# Altium schematic sheet Buck-Boost_Sheet.SchDoc (part 2 of 3)
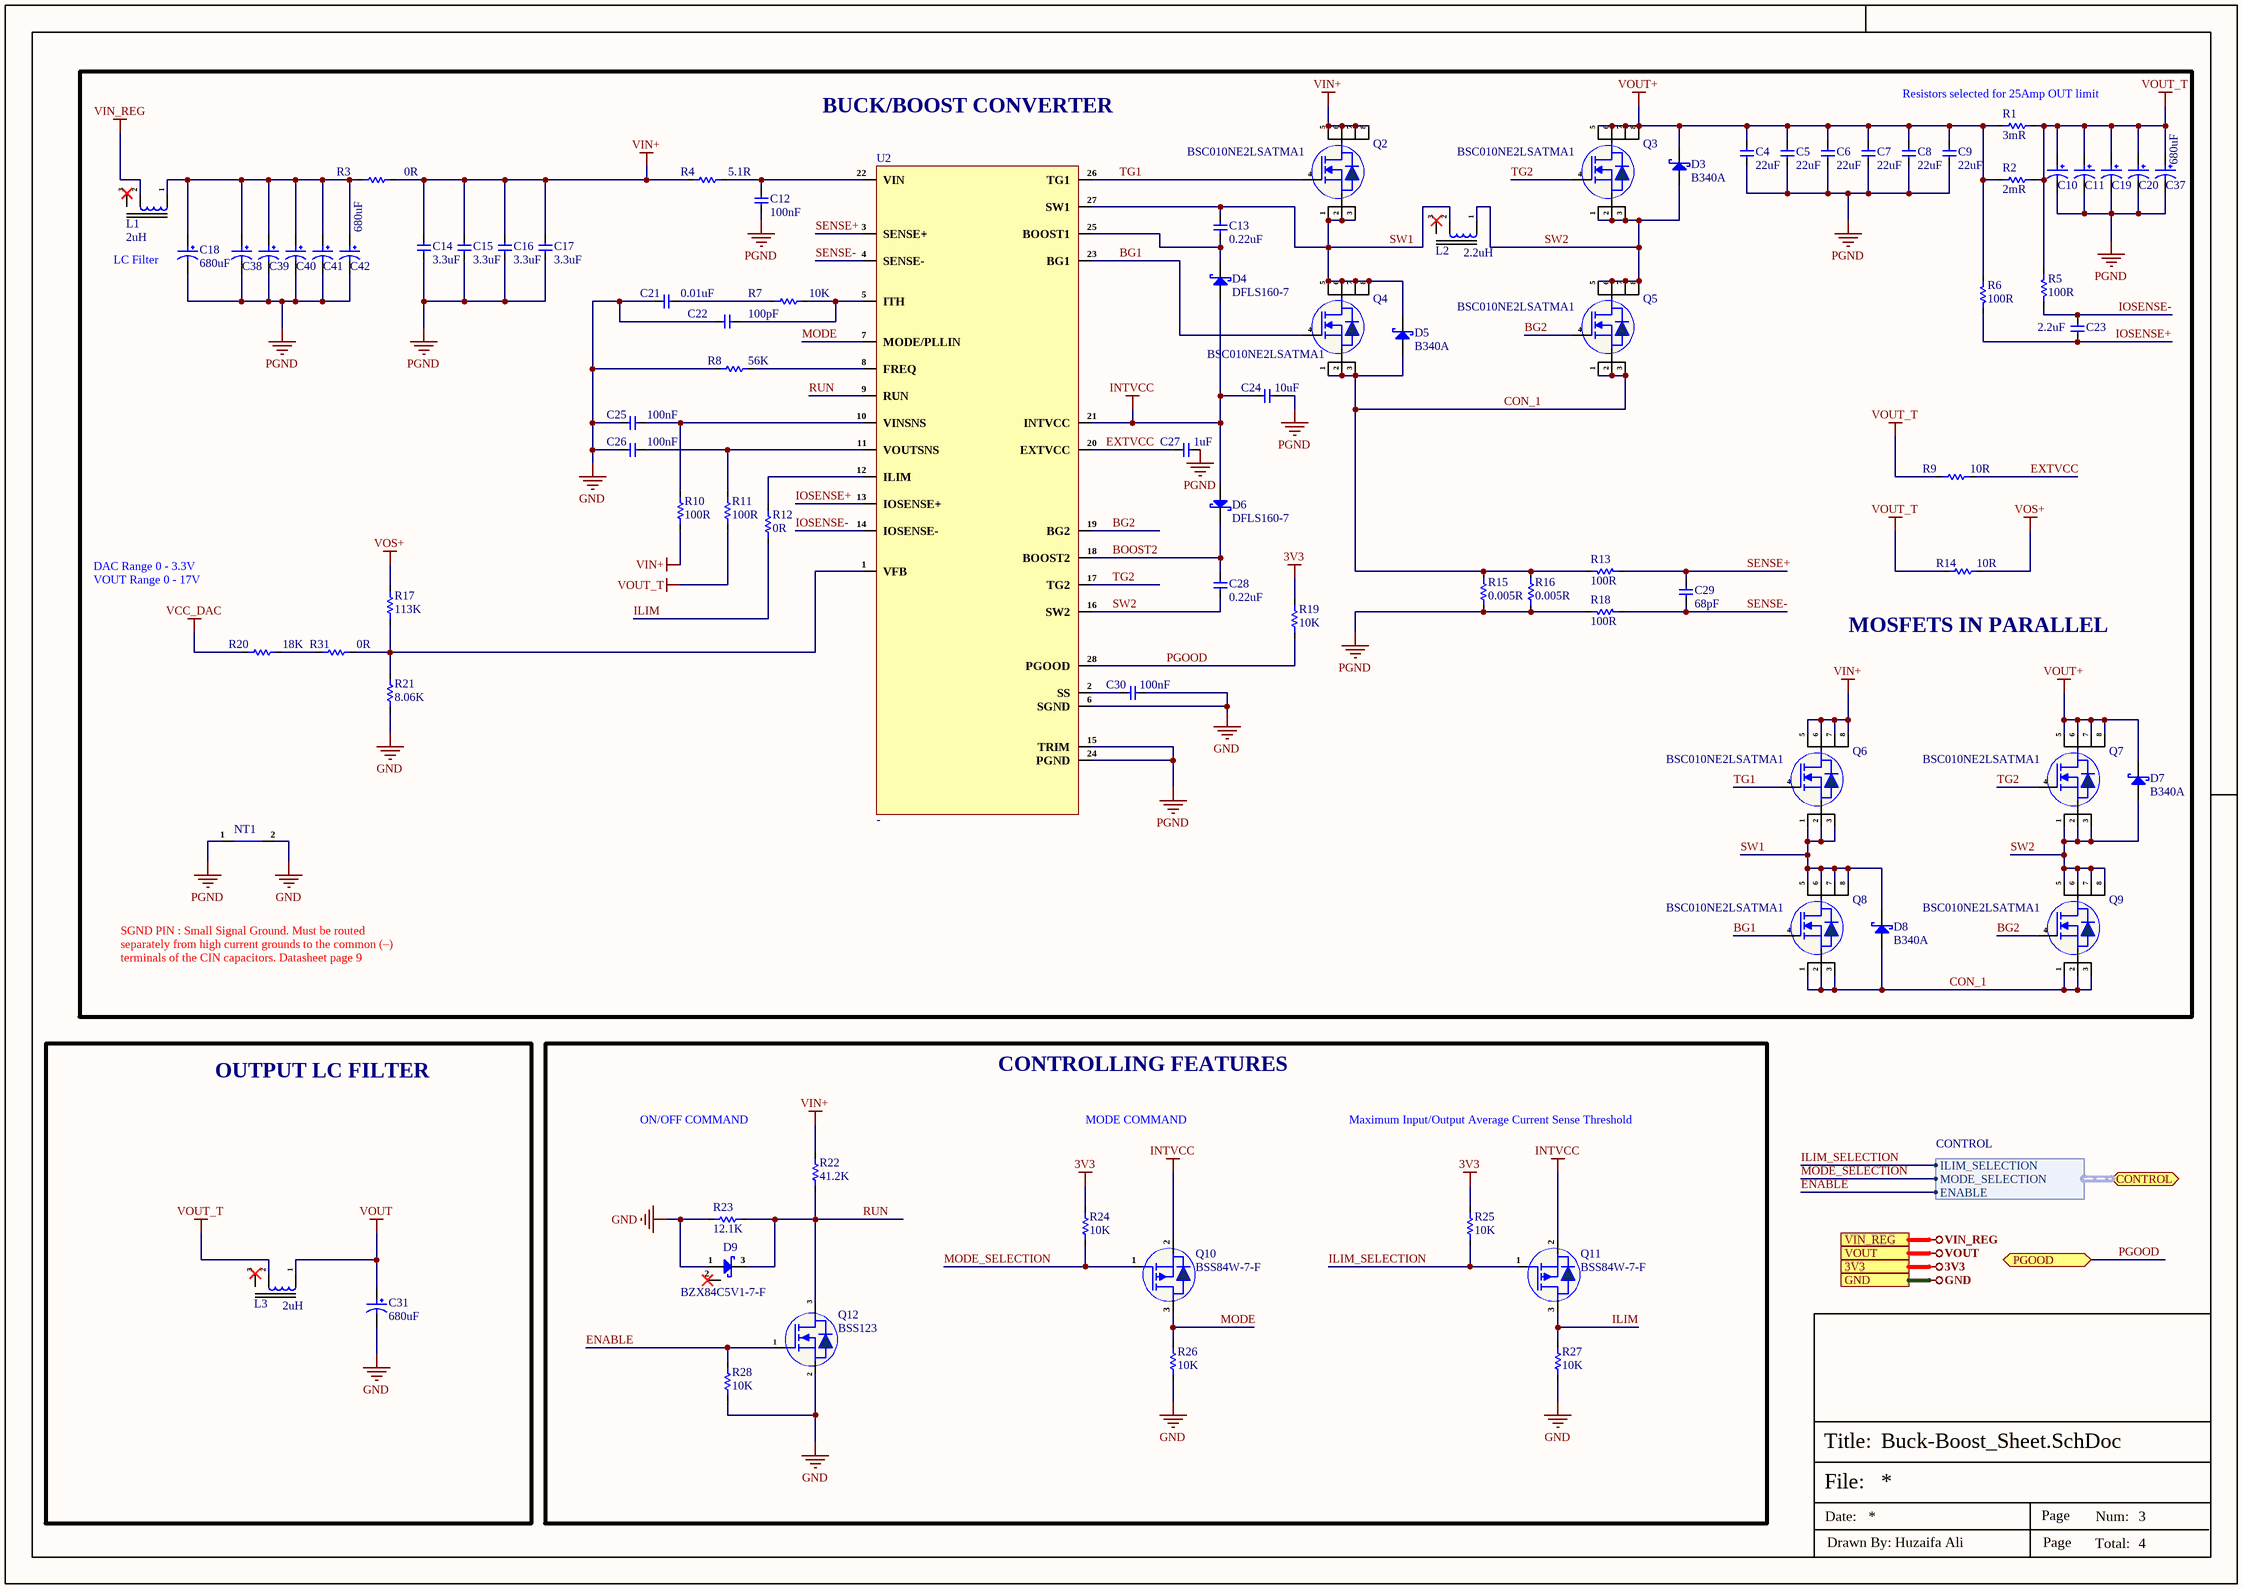
[diagram p1: Buck-Boost_Sheet.SchDoc]
## Library data of the parts
C4-C9 = C3216X5R1E226M160AB: CAP CER 22UF 25V X5R 1206; Manufacturer: TDK; Dielectric Material: Ceramic; Tolerance: 20%; Item Type: Capacitor; Supplier 1: Digi-Key; Manufacturer Part Number: C3216X5R1E226M160AB; Stock 1: 21442; Pricing 1: 1=1.08, 10=0.822, 50=0.6832, 100=0.5882, 500=0.4554, 1000=0.39215 (USD); Mount: Surface Mount; Case/Package: 1206; Case Code (Metric): 3216; Case Code (Imperial): 1206; Weight: 0.000571oz; Min Operating Temperature: -55°C; Max Operating Temperature: 85°C; Voltage Rating: 25V; Capacitance: 22uF; Packaging: Tape and Reel; Voltage Rating (DC): 25V; Dielectric: X5R; Termination: SMD/SMT; Construction: Flat; Package Quantity: 1; Resistor Type: Ceramic; Series: C; Length: 3.2mm; Width: 0.063inch; Height: 1.6mm; Depth: 1.6mm; Thickness: 0.071inch; Lead Free: Lead Free; REACH SVHC: No SVHC; RoHS Compliant: Yes; ComponentLink1URL: https://product.tdk.com/info/en/documents/chara_sheet/C3216X5R1E226M160AB.pdf?src-supplier=Digi-Key; ComponentLink1Description: https://product.tdk.com/info/en/documents/chara_sheet/C3216X5R1E226M160AB.pdf?src-supplier=Digi-Key; ComponentLink2URL: http://www.mouser.com/ds/2/400/lcc_commercial_general_en-837201.pdf?src-supplier=Mouser; ComponentLink2Description: http://www.mouser.com/ds/2/400/lcc_commercial_general_en-837201.pdf?src-supplier=Mouser; Supplier Part Number 1: 445-6000-1-ND; LCSC Part Number: C2167811
C10 C11 C18-C20 C31 C37-C42 = 50PX680MEFC12.5X20: CAP ALUM 680UF 20% 50V RADIAL; Manufacturer: Rubycon; Ripple Current (AC): 980mA; Item Type: Capacitor; Supplier: Digikey; Supplier Part Number: 1189-1409-ND; Manufacturer Part Number: 50PX680MEFC12.5X20; RoHS: Yes; Category: Aluminum Electrolytic Capacitors; Stock: 6533; Pricing: 1=0.99, 10=0.625, 50=0.4704, 100=0.422, 500=0.3404, 1000=0.31546, 3000=0.28945, 5000=0.27403 (USD); Mounting Technology: Through Hole; Case/Package: Radial; Pins: 2; Min Operating Temperature: -55°C; Max Operating Temperature: 105°C; Tolerance: 20%; Value: 680uF; Voltage Rating: 50V; Packaging: Bulk; Voltage Rating (DC): 50V; Series: PX; Diameter: 12.5mm; Height: 20mm; Lead Pitch: 5mm; Reach SVHC Compliant: No; RoHS Compliant: Yes; ComponentLink1URL: https://datasheet.ciiva.com/6327/e-px-6327166.pdf?src-supplier=Digikey; ComponentLink1Description: https://datasheet.ciiva.com/6327/e-px-6327166.pdf?src-supplier=Digikey
C12 C25 C26 C30 = CC0603KRX5R9BB104: CAP CER 0.1UF 50V X5R 0603; Manufacturer: Yageo; Tolerance: 10%; Item Type: Capacitor; Supplier 1: Digi-Key; Manufacturer Part Number: CC0603KRX5R9BB104; RoHS: Yes; Category: Ceramic Capacitors; Stock 1: 152253; Pricing 1: 1=0.10000, 10=0.05200, 50=0.02820, 100=0.02310, 500=0.01648, 1000=0.01294 (USD); Mount: Surface Mount; Case/Package: 0603; Case Code (Imperial): 0603; Case Code (Metric): 1608; Weight: 7.1E-05oz; Min Operating Temperature: -55°C; Max Operating Temperature: 85°C; Capacitance: 100nF; Packaging: Tape and Reel; Voltage Rating: 50V; Dielectric: X5R; Termination: SMD/SMT; Voltage Rating (DC): 50V; Package Quantity: 4000; Length: 0.063inch; Width: 0.031inch; Thickness: 0.035inch; Lead Free: Lead Free; Halogen Free: Halogen Free; ComponentLink1URL: http://www.mouser.com/ds/2/447/Yageo_UPY-GP_NP0_16V-to-50V_9-358835.pdf?src-supplier=Mouser; ComponentLink1Description: http://www.mouser.com/ds/2/447/Yageo_UPY-GP_NP0_16V-to-50V_9-358835.pdf?src-supplier=Mouser; ComponentLink2URL: https://www.yageo.com/upload/media/product/productsearch/datasheet/mlcc/UPY-GPHC_X5R_4V-to-50V_26.pdf?src-supplier=Digi-Key; ComponentLink2Description: https://www.yageo.com/upload/media/product/productsearch/datasheet/mlcc/UPY-GPHC_X5R_4V-to-50V_26.pdf?src-supplier=Digi-Key; ComponentLink3URL: http://www.yageo.com/exep/pages/download/literatures/ProductSelectionGuide%202014_Final_2.pdf?src-supplier=Digi-Key; ComponentLink3Description: http://www.yageo.com/exep/pages/download/literatures/ProductSelectionGuide%202014_Final_2.pdf?src-supplier=Digi-Key; Supplier Part Number 1: 311-4046-1-ND; LCSC Part Number: C110022
C13 C28 = CC0402KRX5R8BB224: CAP CER 0.22UF 25V X5R 0402; Manufacturer: Yageo; Capacitance: 220nF; Tolerance: 10%; Supplier 1: Mouser; Manufacturer Part Number: CC0402KRX5R8BB224; RoHS: Yes; Category: Ceramic Capacitors; Stock 1: 61266; Pricing 1: 1=0.10000, 10=0.03300, 50=0.03300, 100=0.02700, 1000=0.01500, 10000=0.01300 (USD); Mount: Surface Mount; Case/Package: 0402; Min Operating Temperature: -55°C; Max Operating Temperature: 85°C; Packaging: Tape and Reel; Voltage Rating: 25V; Voltage Rating (DC): 25V; Dielectric: X5R; Length: 0.039inch; Width: 0.02inch; Thickness: 0.022inch; Lead Free: Lead Free; Halogen Free: Halogen Free; RoHS Compliant: Yes; ComponentLink1URL: http://www.yageo.com/documents/recent/UPY-GPHC_X5R_4V-to-50V_25.pdf?src-supplier=Digi-Key; ComponentLink1Description: http://www.yageo.com/documents/recent/UPY-GPHC_X5R_4V-to-50V_25.pdf?src-supplier=Digi-Key; ComponentLink2URL: https://www.yageo.com/upload/media/product/productsearch/datasheet/mlcc/UPY-GPHC_X5R_4V-to-50V_26.pdf?src-supplier=Digi-Key; ComponentLink2Description: https://www.yageo.com/upload/media/product/productsearch/datasheet/mlcc/UPY-GPHC_X5R_4V-to-50V_26.pdf?src-supplier=Digi-Key; ComponentLink3URL: http://www.yageo.com/documents/recent/UPY-GPHC_X5R_4V-to-50V_23.pdf?src-supplier=Digi-Key; ComponentLink3Description: http://www.yageo.com/documents/recent/UPY-GPHC_X5R_4V-to-50V_23.pdf?src-supplier=Digi-Key; Supplier Part Number 1: 603-CC402KRX5R8BB224; LCSC Part Number: C326836
C14-C17 = C1210C335K5RAC7800: CAP CER 3.3UF 50V X7R 1210; Manufacturer: KEMET; Item Type: Capacitor; Manufacturer Part Number: C1210C335K5RAC7800; Package: 1210
C21 = GRM1885C1H103JA01D: CAP CER 10000PF 50V C0G/NP0 0603; Manufacturer: Murata; Material: Ceramic; Capacitance: 10nF; Tolerance: 5%; Dielectric: C0G; Supplier 1: RSComponents; Manufacturer Part Number: GRM1885C1H103JA01D; RoHS: Yes; Category: Ceramic Capacitors; Stock 1: 80000; Pricing 1: 4000=0.03500, 8000=0.03200 (GBP); Mount: Surface Mount; Case/Package: 0603; Case Code (Metric): 1608; Case Code (Imperial): 0603; Min Operating Temperature: -55°C; Max Operating Temperature: 125°C; Packaging: Tape and Reel; Package Quantity: 4000; Voltage Rating: 50V; Voltage Rating (DC): 50V; Termination: SMD/SMT; Voltage: 50V; Series: GRM; Length: 1.6mm; Width: 0.8mm; Height: 0.8mm; Thickness: 0.035inch; Lead Pitch: 0.5mm; Depth: 0.8mm; REACH SVHC: No SVHC; Lead Free: Lead Free; RoHS Compliant: Yes; ComponentLink1URL: https://datasheet.ciiva.com/41860/partnumbering-e-01-41860759.pdf?src-supplier=Digi-Key; ComponentLink1Description: https://datasheet.ciiva.com/41860/partnumbering-e-01-41860759.pdf?src-supplier=Digi-Key; ComponentLink2URL: https://datasheet.ciiva.com/29537/partnumbering-e-01-29537910.pdf?src-supplier=Digi-Key; ComponentLink2Description: https://datasheet.ciiva.com/29537/partnumbering-e-01-29537910.pdf?src-supplier=Digi-Key; Supplier Part Number 1: 1449032
C22 = CC0603JRNPO9BN101: CAP CER 100PF 50V C0G/NPO 0603; Manufacturer: Yageo; Tolerance: 5%; Dielectric: C0G; Temperature Coefficient: 30ppm/°C; Insulation Resistance: 100GR; Supplier 1: Arrow Electronics; Manufacturer Part Number: CC0603JRNPO9BN101; RoHS: Yes; Category: Ceramic Capacitors; Stock 1: 10744; Pricing 1: 1=0.06030, 10=0.04400, 25=0.02170, 100=0.01580, 250=0.01330, 500=0.01300, 1000=0.01150, 3000=0.01010, 6000=0.00680 (USD); Mount: Surface Mount; Case/Package: 0603; Number of Pins: 2; Case Code (Imperial): 0603; Case Code (Metric): 1608; Min Operating Temperature: -55°C; Max Operating Temperature: 125°C; Capacitance: 100pF; Voltage: 50V; Voltage Rating: 50V; Voltage Rating (DC): 50V; Packaging: Tape and Reel; Package Quantity: 1; Termination: SMD/SMT; Resistor Type: Ceramic; Series: CC; Length: 1.6mm; Width: 0.8mm; Height: 0.8mm; Thickness: 0.035inch; Depth: 0.8mm; Radiation Hardening: No; RoHS Compliant: Yes; REACH SVHC: Unknown; Lead Free: Lead Free; ComponentLink1URL: https://datasheet.ciiva.com/11786/0900766b8079c870-11786060.pdf?src-supplier=RSComponents; ComponentLink1Description: https://datasheet.ciiva.com/11786/0900766b8079c870-11786060.pdf?src-supplier=RSComponents; ComponentLink2URL: https://datasheet.ciiva.com/7978/1443161-7978127.pdf?src-supplier=Element14; ComponentLink2Description: https://datasheet.ciiva.com/7978/1443161-7978127.pdf?src-supplier=Element14; ComponentLink3URL: https://datasheet.ciiva.com/28450/1443161-28450457.pdf?src-supplier=Element14; ComponentLink3Description: https://datasheet.ciiva.com/28450/1443161-28450457.pdf?src-supplier=Element14; ComponentLink4URL: https://datasheet.ciiva.com/46430/1835847-46430151.pdf?src-supplier=Element14; ComponentLink4Description: https://datasheet.ciiva.com/46430/1835847-46430151.pdf?src-supplier=Element14; ComponentLink5URL: https://datasheet.ciiva.com/144/mlccorderingcode-144629.pdf?src-supplier=Digi-Key; ComponentLink5Description: https://datasheet.ciiva.com/144/mlccorderingcode-144629.pdf?src-supplier=Digi-Key; ComponentLink6URL: https://datasheet.ciiva.com/144/mlccorderingcode-144628.pdf?src-supplier=Digi-Key; ComponentLink6Description: https://datasheet.ciiva.com/144/mlccorderingcode-144628.pdf?src-supplier=Digi-Key; ComponentLink7URL: https://datasheet.ciiva.com/144/mlccorderingcode-144630.pdf?src-supplier=Digi-Key; ComponentLink7Description: https://datasheet.ciiva.com/144/mlccorderingcode-144630.pdf?src-supplier=Digi-Key; ComponentLink8URL: https://datasheet.ciiva.com/11464/upy-gp-np0-16v-to-50v-8-11464725.pdf?src-supplier=Avnet; ComponentLink8Description: https://datasheet.ciiva.com/11464/upy-gp-np0-16v-to-50v-8-11464725.pdf?src-supplier=Avnet; ComponentLink9URL: https://datasheet.ciiva.com/26829/getdatasheetpartid-403525-26829372.pdf?src-supplier=Verical; ComponentLink9Description: https://datasheet.ciiva.com/26829/getdatasheetpartid-403525-26829372.pdf?src-supplier=Verical; Supplier Part Number 1: CC0603JRNPO9BN101; LCSC Part Number: C14665
C23 = CC0603KRX5R8BB225: CAP CER 2.2UF 25V X5R 0603; Manufacturer: Yageo; Tolerance: 10%; Item Type: Capacitor; Supplier 1: Digi-Key; Manufacturer Part Number: CC0603KRX5R8BB225; Stock 1: 687936; Pricing 1: 1=0.4, 10=0.276, 50=0.1932, 100=0.1656, 500=0.1242, 1000=0.10488 (USD); Mount: Surface Mount; Case/Package: 0603; Case Code (Metric): 1608; Case Code (Imperial): 0603; Weight: 7.1E-05oz; Min Operating Temperature: -55°C; Max Operating Temperature: 85°C; Packaging: Tape and Reel; Capacitance: 2.2uF; Dielectric: X5R; Voltage Rating: 25V; Termination: SMD/SMT; Resistor Type: Ceramic; Voltage Rating (DC): 25V; Package Quantity: 4000; Length: 1.6mm; Width: 0.031inch; Thickness: 0.037inch; Depth: 0.8mm; Radiation Hardening: No; Lead Free: Lead Free; Halogen Free: Halogen Free; RoHS Compliant: Yes; ComponentLink1URL: https://www.verical.com/server-webapp/html/getDatasheet?partID=782757&src-supplier=Verical; ComponentLink1Description: https://www.verical.com/server-webapp/html/getDatasheet?partID=782757&src-supplier=Verical; Supplier Part Number 1: 311-1786-1-ND; LCSC Part Number: C309478
C24 = CC1206KKX5R8BB106: CAP CER 10UF 25V X5R 1206; Manufacturer: Yageo; Tolerance: 10%; Supplier 1: Digi-Key; Manufacturer Part Number: CC1206KKX5R8BB106; RoHS: Yes; Category: Ceramic Capacitors; Stock 1: 206954; Pricing 1: 1=0.56000, 10=0.39800, 50=0.30080, 100=0.26190, 500=0.19402, 1000=0.16492 (USD); Mount: Surface Mount; Case/Package: 1206; Number of Pins: 2; Case Code (Imperial): 1206; Case Code (Metric): 3216; Min Operating Temperature: -55°C; Max Operating Temperature: 85°C; Capacitance: 10uF; Dielectric: X5R; Packaging: Tape and Reel; Voltage Rating: 25V; Package Quantity: 1; Termination: SMD/SMT; Voltage Rating (DC): 25V; Series: CC; Construction: Flat; Length: 3.2mm; Width: 0.063inch; Height: 1.6mm; Thickness: 0.071inch; Depth: 1.6mm; Radiation Hardening: No; Lead Free: Lead Free; Halogen Free: Halogen Free; RoHS Compliant: Yes; ComponentLink1URL: https://datasheet.ciiva.com/184/mlccorderingcode-184043.pdf?src-supplier=Digi-Key; ComponentLink1Description: https://datasheet.ciiva.com/184/mlccorderingcode-184043.pdf?src-supplier=Digi-Key; ComponentLink2URL: https://datasheet.ciiva.com/184/mlccorderingcode-184042.pdf?src-supplier=Digi-Key; ComponentLink2Description: https://datasheet.ciiva.com/184/mlccorderingcode-184042.pdf?src-supplier=Digi-Key; ComponentLink3URL: https://datasheet.ciiva.com/184/mlccorderingcode-184044.pdf?src-supplier=Digi-Key; ComponentLink3Description: https://datasheet.ciiva.com/184/mlccorderingcode-184044.pdf?src-supplier=Digi-Key; ComponentLink4URL: https://datasheet.ciiva.com/11466/upy-gphc-x5r-4v-to-50v-12-11466558.pdf?src-supplier=Avnet; ComponentLink4Description: https://datasheet.ciiva.com/11466/upy-gphc-x5r-4v-to-50v-12-11466558.pdf?src-supplier=Avnet; ComponentLink5URL: https://datasheet.ciiva.com/15189/getdatasheetpartid-344055-15189254.pdf?src-supplier=Verical; ComponentLink5Description: https://datasheet.ciiva.com/15189/getdatasheetpartid-344055-15189254.pdf?src-supplier=Verical; Supplier Part Number 1: 311-1466-1-ND
C27 = CC0603KRX5R8BB105: CAP CER 1UF 25V X5R 0603; Manufacturer: Yageo; Tolerance: 10%; Item Type: Capacitor; Supplier 1: Digi-Key; Manufacturer Part Number: CC0603KRX5R8BB105; RoHS: Yes; Category: Ceramic Capacitors; Stock 1: 919939; Pricing 1: 1=0.12000, 10=0.08400, 50=0.04760, 100=0.03940, 500=0.02764, 1000=0.02288 (USD); Mount: Surface Mount; Case/Package: 0603; Number of Pins: 2; Case Code (Metric): 1608; Case Code (Imperial): 0603; Min Operating Temperature: -55°C; Max Operating Temperature: 85°C; Capacitance: 1uF; Dielectric: X5R; Package Quantity: 1; Voltage Rating: 25V; Packaging: Tape and Reel; Termination: SMD/SMT; Voltage Rating (DC): 25V; Series: CC; Construction: Flat; Length: 1.6mm; Width: 0.031inch; Height: 0.8mm; Thickness: 0.035inch; Depth: 0.8mm; Radiation Hardening: No; REACH SVHC: No SVHC; Lead Free: Lead Free; Halogen Free: Halogen Free; RoHS Compliant: Yes; ComponentLink1URL: https://datasheet.ciiva.com/176/mlccorderingcode-176785.pdf?src-supplier=Digi-Key; ComponentLink1Description: https://datasheet.ciiva.com/176/mlccorderingcode-176785.pdf?src-supplier=Digi-Key; ComponentLink2URL: https://datasheet.ciiva.com/176/mlccorderingcode-176786.pdf?src-supplier=Digi-Key; ComponentLink2Description: https://datasheet.ciiva.com/176/mlccorderingcode-176786.pdf?src-supplier=Digi-Key; ComponentLink3URL: https://datasheet.ciiva.com/176/mlccorderingcode-176787.pdf?src-supplier=Digi-Key; ComponentLink3Description: https://datasheet.ciiva.com/176/mlccorderingcode-176787.pdf?src-supplier=Digi-Key; ComponentLink4URL: https://datasheet.ciiva.com/17436/upy-gphc-x5r-4v-to-50v-12-17436952.pdf?src-supplier=Avnet+Europe; ComponentLink4Description: https://datasheet.ciiva.com/17436/upy-gphc-x5r-4v-to-50v-12-17436952.pdf?src-supplier=Avnet+Europe; ComponentLink5URL: https://datasheet.ciiva.com/7978/1525783-7978171.pdf?src-supplier=Element14; ComponentLink5Description: https://datasheet.ciiva.com/7978/1525783-7978171.pdf?src-supplier=Element14; ComponentLink6URL: https://datasheet.ciiva.com/11586/upy-gphc-x5r-4v-to-50v-12-11586318.pdf?src-supplier=Avnet; ComponentLink6Description: https://datasheet.ciiva.com/11586/upy-gphc-x5r-4v-to-50v-12-11586318.pdf?src-supplier=Avnet; Supplier Part Number 1: 311-1445-1-ND; LCSC Part Number: C14664
C29 = CGA3E2C0G2A680JT0Y0N: CAP CER 68PF 100V C0G 0603; Manufacturer: TDK; Item Type: Capacitor; Manufacturer Part Number: CGA3E2C0G2A680JT0Y0N; Package: 0603; LCSC Part Number: C694224
D3 D5 D7 D8 = B340A: 40V 3A 550mV@3A SMA(DO-214AC) Schottky Barrier Diodes (SBD) ROHS; Manufacturer: FUXINSEMI; Item Type: Diode; Manufacturer Part Number: B340A; Package: SMA(DO-214AC); LCSC Part Number: C3018525; ComponentLink1Description: LCSC; ComponentLink1URL: https://www.lcsc.com/product-detail/Schottky-Barrier-Diodes-SBD_FUXINSEMI-B340A_C3018525.html
D4 D6 = DFLS160-7: DIODE SCHOTTKY 60V 1A PWRDI123; Manufacturer: Diodes; Max Reverse Current: 100uA; Peak Non-Repetitive Surge Current: 50A; Forward Voltage: 500mV; Polarity: Standard; Value: 67pF; Supplier: Future Electronics; Supplier Part Number: 3129421; Manufacturer Part Number: DFLS160-7; RoHS: Yes; Category: Rectifier Diodes; Stock: 33000; Pricing: 3000=0.103, 6000=0.1, 9000=0.0986, 12000=0.0975, 15000=0.0941 (USD); Mounting Technology: Surface Mount; Pins: 2; Min Operating Temperature: -65°C; Max Operating Temperature: 150°C; Forward Current: 1A; Max Repetitive Reverse Voltage (Vrrm): 60V; Packaging: Tape and Reel; Package Quantity: 3000; Average Rectified Current: 1A; Max Forward Surge Current (Ifsm): 50A; Termination: SMD/SMT; Voltage Rating (DC): 60V; Current Rating: 1A; Output Current: 1A; Max Reverse Voltage (DC): 60V; Series: -; Length: 2.8mm; Width: 1.78mm; Height: 0.98mm; Radiation Hardening: No; Reach SVHC Compliant: No; Lead Free: Lead Free; RoHS Compliant: Yes; ComponentLink1URL: https://datasheet.ciiva.com/8301/ds30548-8301937.pdf?src-supplier=Avnet; ComponentLink1Description: https://datasheet.ciiva.com/8301/ds30548-8301937.pdf?src-supplier=Avnet; ComponentLink2URL: https://datasheet.ciiva.com/4715/ds30548-86621-4715693.pdf?src-supplier=Mouser; ComponentLink2Description: https://datasheet.ciiva.com/4715/ds30548-86621-4715693.pdf?src-supplier=Mouser; ComponentLink3URL: https://datasheet.ciiva.com/16958/0900766b80e30da9-16958716.pdf?src-supplier=Allied+Electronics; ComponentLink3Description: https://datasheet.ciiva.com/16958/0900766b80e30da9-16958716.pdf?src-supplier=Allied+Electronics; ComponentLink4URL: https://datasheet.ciiva.com/22695/ds30548-22695808.pdf?src-supplier=Element14; ComponentLink4Description: https://datasheet.ciiva.com/22695/ds30548-22695808.pdf?src-supplier=Element14; ComponentLink5URL: https://datasheet.ciiva.com/16199/ds30548-16199750.pdf?src-supplier=Future+Electronics; ComponentLink5Description: https://datasheet.ciiva.com/16199/ds30548-16199750.pdf?src-supplier=Future+Electronics; ComponentLink6URL: https://datasheet.ciiva.com/914/ds30548-914331.pdf?src-supplier=Digikey; ComponentLink6Description: https://datasheet.ciiva.com/914/ds30548-914331.pdf?src-supplier=Digikey; ComponentLink7URL: https://datasheet.ciiva.com/914/ds30548-914332.pdf?src-supplier=Digikey; ComponentLink7Description: https://datasheet.ciiva.com/914/ds30548-914332.pdf?src-supplier=Digikey; ComponentLink8URL: https://datasheet.ciiva.com/914/ds30548-914333.pdf?src-supplier=Digikey; ComponentLink8Description: https://datasheet.ciiva.com/914/ds30548-914333.pdf?src-supplier=Digikey; ComponentLink9URL: https://datasheet.ciiva.com/7964/ds30548-7964253.pdf?src-supplier=Element14; ComponentLink9Description: https://datasheet.ciiva.com/7964/ds30548-7964253.pdf?src-supplier=Element14; Item Type: Diode
D9 = BZX84C5V1-7-F: DIODE ZENER 5.1V 300MW SOT23-3; Manufacturer: Diodes; Max Power Dissipation: 350mW; Max Reverse Leakage Current: 2uA; Tolerance: 6%; Forward Voltage: 900mV; Impedance: 60R; Zener Current: 5mA; Output Current: 50mA; ESD Protection: No; Supplier: Future Electronics; Supplier Part Number: 5442215; Manufacturer Part Number: BZX84C5V1-7-F; RoHS: Yes; Category: Zener Diodes; Stock: 54000; Pricing: 3000=0.017, 12000=0.0163, 30000=0.0158, 75000=0.0153, 120000=0.0147 (USD); Mounting Technology: Surface Mount; Case/Package: SOT-23; Pins: 3; Weight: 0.000282oz; Contact Plating: Tin,Matte; Min Operating Temperature: -65°C; Max Operating Temperature: 150°C; Packaging: Tape and Reel; Zener Voltage: 5.1V; Series: -; Package Quantity: 3000; Power Dissipation: 350mW; Voltage Tolerance: 6%; Working Voltage: 5.1V; Max Reverse Current: 2uA; Test Current: 5mA; Termination: SMD/SMT; Power Rating: 350mW; Voltage Rating (DC): 5.1V; Length: 2.9mm; Width: 1.3mm; Height: 1mm; Radiation Hardening: No; RoHS Compliant: Yes; Reach SVHC Compliant: No; Lead Free: Lead Free; ComponentLink1URL: https://datasheet.ciiva.com/15141/getdatasheetpartid-28228-15141875.pdf?src-supplier=Verical; ComponentLink1Description: https://datasheet.ciiva.com/15141/getdatasheetpartid-28228-15141875.pdf?src-supplier=Verical; ComponentLink2URL: https://datasheet.ciiva.com/34303/2011627-34303826.pdf?src-supplier=Jameco; ComponentLink2Description: https://datasheet.ciiva.com/34303/2011627-34303826.pdf?src-supplier=Jameco; ComponentLink3URL: https://datasheet.ciiva.com/10643/ds18001-10643286.pdf?src-supplier=Avnet; ComponentLink3Description: https://datasheet.ciiva.com/10643/ds18001-10643286.pdf?src-supplier=Avnet; ComponentLink4URL: https://datasheet.ciiva.com/8347/ds18001-8347273.pdf?src-supplier=Avnet; ComponentLink4Description: https://datasheet.ciiva.com/8347/ds18001-8347273.pdf?src-supplier=Avnet; Item Type: Diode
L1 L3 = SER2011-202MLD: FIXED IND 2UH 40A 1.34MOHM SM; Manufacturer: Coilcraft; Core Material: Ferrite; Tolerance: 20%; Self Resonant Frequency: 56MHz; Shielding: Shielded; DC Resistance (DCR): 1.2mR; Test Frequency: 100kHz; Saturation Current: 37A; Item Type: Inductor; Supplier: Mouser; Supplier Part Number: 994-SER2011-202MLD; Manufacturer Part Number: SER2011-202MLD; RoHS: Yes; Category: Fixed Inductors; Stock: 1078; Pricing: 1=3.01, 10=3.01, 50=3.01, 100=3.01, 1000=2.19, 10000=2.19 (USD); Pins: 3; Min Operating Temperature: -40°C; Max Operating Temperature: 85°C; Packaging: Tape and Reel; Value: 2uH; Max DC Current: 40A; Termination: SMD/SMT; Series: SER2011; Inductance Tolerance: 20%; DC Current: 40A; RMS Current (Irms): 40A; Length: 19.69mm; Width: 19.55mm; Height: 10.67mm; Depth: 19.56mm; Radiation Hardening: No; Lead Free: Contains Lead; RoHS Compliant: Yes; Reach SVHC Compliant: No; Military Standard: Not; ComponentLink1URL: https://datasheet.ciiva.com/15211/getdatasheetpartid-476881-15211386.pdf?src-supplier=Verical; ComponentLink1Description: https://datasheet.ciiva.com/15211/getdatasheetpartid-476881-15211386.pdf?src-supplier=Verical; ComponentLink2URL: https://datasheet.ciiva.com/46438/1681979-46438646.pdf?src-supplier=Element14; ComponentLink2Description: https://datasheet.ciiva.com/46438/1681979-46438646.pdf?src-supplier=Element14; ComponentLink3URL: https://datasheet.ciiva.com/46438/1681979-46438647.pdf?src-supplier=Element14; ComponentLink3Description: https://datasheet.ciiva.com/46438/1681979-46438647.pdf?src-supplier=Element14; ComponentLink4URL: https://datasheet.ciiva.com/46438/1681979-46438648.pdf?src-supplier=Element14; ComponentLink4Description: https://datasheet.ciiva.com/46438/1681979-46438648.pdf?src-supplier=Element14; ComponentLink5URL: https://datasheet.ciiva.com/13142/ser2000-13142426.pdf?src-supplier=Mouser; ComponentLink5Description: https://datasheet.ciiva.com/13142/ser2000-13142426.pdf?src-supplier=Mouser
L2 = SER2915L-222KL: FIXED IND 2.2UH 30A 1.65MOHM SM; Manufacturer: Coilcraft; Core Material: Ferrite; Tolerance: 10%; Self Resonant Frequency: 50MHz; Shielding: Shielded; Max DC Current: 84.8A; Test Frequency: 100kHz; Saturation Current: 82A; Item Type: Inductor; Supplier: Mouser; Supplier Part Number: 994-SER2915L-222KL; Manufacturer Part Number: SER2915L-222KL; RoHS: Yes; Category: Fixed Inductors; Stock: 187; Pricing: 1=4.14, 10=4.14, 50=4.14, 100=4.14, 1000=3.01, 10000=3.01 (USD); Mounting Technology: Surface Mount; Case/Package: SMD/SMT; Min Operating Temperature: -40°C; Max Operating Temperature: 85°C; Packaging: Tray; Package Quantity: 25; Inductance Tolerance: 10%; Value: 2.2uH; Termination: SMD/SMT; RMS Current (Irms): 30A; Series: SER2915L; Length: 27.9mm; Width: 19.8mm; Height: 15.36mm; Reach SVHC Compliant: No; Lead Free: Contains Lead; RoHS Compliant: Yes; ComponentLink1URL: http://www.mouser.com/ds/2/597/ser2900-270685.pdf?src-supplier=Mouser; ComponentLink1Description: http://www.mouser.com/ds/2/597/ser2900-270685.pdf?src-supplier=Mouser; ComponentLink2URL: http://www.farnell.com/datasheets/1681984.pdf?src-supplier=Farnell; ComponentLink2Description: http://www.farnell.com/datasheets/1681984.pdf?src-supplier=Farnell; ComponentLink3URL: http://www.farnell.com/datasheets/1681984.pdf?src-supplier=Element14; ComponentLink3Description: http://www.farnell.com/datasheets/1681984.pdf?src-supplier=Element14
NT1 = Net Tie_SMD: Net Tie SMD; Manufacturer Part Number: Net Tie; Item Type: Net Tie Pad
Q2-Q9 = BSC010NE2LSATMA1: Mosfet N-ch 25V 39A TDSON-8 / Trans Mosfet N-ch 25V 39A Automotive 8-PIN Tdson Ep T/r; Manufacturer: Infineon; Rise Time: 6ns; Gate to Source Voltage (Vgs): 20V; Rds On Max: 1mR; Input Capacitance: 4.7nF; Max Power Dissipation: 96W; Number of Elements: 1; Item Type: MOSFET; Supplier: Mouser; Supplier Part Number: 726-BSC010NE2LS; Manufacturer Part Number: BSC010NE2LSATMA1; RoHS: Yes; Category: MOSFETs; Stock: 23008; Pricing: 1=1.65, 10=1.44, 50=1.44, 100=1.36, 1000=1.31, 10000=1.11 (USD); Mounting Technology: Surface Mount; Pins: 8; Contact Plating: Tin; Min Operating Temperature: -55°C; Max Operating Temperature: 150°C; Packaging: Tape and Reel; Continuous Drain Current (ID): 39A; Series: OptiMOS™; Power Dissipation: 96W; Max Dual Supply Voltage: 25V; Drain to Source Voltage (Vdss): 25V; Lead Free: Contains Lead; Halogen Free: Halogen Free; RoHS Compliant: Yes; ComponentLink1URL: https://datasheet.ciiva.com/11172/infineon-bsc010ne2ls-ds-v02-02-en-11172774.pdf?src-supplier=Avnet; ComponentLink1Description: https://datasheet.ciiva.com/11172/infineon-bsc010ne2ls-ds-v02-02-en-11172774.pdf?src-supplier=Avnet
Q10 Q11 = BSS84W-7-F: MOSFET P-CH 50V 130MA SOT323; Manufacturer: Diodes; Supplier: Future Electronics; Supplier Part Number: 3204492; Manufacturer Part Number: BSS84W-7-F; RoHS: Yes; Category: MOSFETs; Stock: 1359000; Pricing: 3000=0.415, 9000=0.405, 30000=0.39, 60000=0.385, 120000=0.375 (USD); ComponentLink1URL: https://datasheet.ciiva.com/17082/bss84w-7-f-17082780.pdf?src-supplier=Allied+Electronics; ComponentLink1Description: https://datasheet.ciiva.com/17082/bss84w-7-f-17082780.pdf?src-supplier=Allied+Electronics; ComponentLink2URL: https://datasheet.ciiva.com/15137/getdatasheetpartid-91759-15137729.pdf?src-supplier=Verical; ComponentLink2Description: https://datasheet.ciiva.com/15137/getdatasheetpartid-91759-15137729.pdf?src-supplier=Verical; ComponentLink3URL: https://datasheet.ciiva.com/19479/1539489-19479838.pdf?src-supplier=Jameco; ComponentLink3Description: https://datasheet.ciiva.com/19479/1539489-19479838.pdf?src-supplier=Jameco; ComponentLink4URL: https://datasheet.ciiva.com/4442/ds30205-79185-4442986.pdf?src-supplier=Mouser; ComponentLink4Description: https://datasheet.ciiva.com/4442/ds30205-79185-4442986.pdf?src-supplier=Mouser; ComponentLink5URL: https://datasheet.ciiva.com/8115/ds30205-8115434.pdf?src-supplier=Avnet; ComponentLink5Description: https://datasheet.ciiva.com/8115/ds30205-8115434.pdf?src-supplier=Avnet; ComponentLink6URL: https://datasheet.ciiva.com/934/ds30205-934605.pdf?src-supplier=Digi-Key; ComponentLink6Description: https://datasheet.ciiva.com/934/ds30205-934605.pdf?src-supplier=Digi-Key; ComponentLink7URL: https://datasheet.ciiva.com/934/ds30205-934606.pdf?src-supplier=Digi-Key; ComponentLink7Description: https://datasheet.ciiva.com/934/ds30205-934606.pdf?src-supplier=Digi-Key; ComponentLink8URL: https://datasheet.ciiva.com/934/ds30205-934607.pdf?src-supplier=Digi-Key; ComponentLink8Description: https://datasheet.ciiva.com/934/ds30205-934607.pdf?src-supplier=Digi-Key; ComponentLink9URL: https://datasheet.ciiva.com/1190/ds30205-1190308.pdf?src-supplier=Element14; ComponentLink9Description: https://datasheet.ciiva.com/1190/ds30205-1190308.pdf?src-supplier=Element14; ComponentLink10URL: https://datasheet.ciiva.com/8115/ds30205-8115325.pdf?src-supplier=Avnet; ComponentLink10Description: https://datasheet.ciiva.com/8115/ds30205-8115325.pdf?src-supplier=Avnet; LCSC Part Number: C110490; Item Type: Mosfet
Q12 = BSS123: 100V 200mA 300mW 1.06Ω@10V,200mA 3V@250uA N Channel SOT-23 MOSFETs ROHS; Manufacturer: BORN; Item Type: Mosfet; Manufacturer Part Number: BSS123; Package: SOT-23; LCSC Part Number: C431506; ComponentLink1Description: LCSC; ComponentLink1URL: https://www.lcsc.com/product-detail/MOSFETs_BORN-BSS123_C431506.html
R1 = CRE2512-FZ-R003E-3: RES 0.003 OHM 1% 3W 2512; Manufacturer: Bourns; Temperature Coefficient: 75ppm/°C; Item Type: Resistor; Supplier: Rs; Supplier Part Number: 2330765; Manufacturer Part Number: CRE2512-FZ-R003E-3; RoHS: No; Category: Chip SMD Resistors; Stock: 5080; Pricing: 10=0.364, 50=0.325, 100=0.316, 500=0.307, 1000=0.3 (GBP); Mounting Technology: Surface Mount; Case/Package: 2512; Case Code (Metric): 6432; Case Code (Imperial): 2512; Contact Plating: Tin; Min Operating Temperature: -55°C; Max Operating Temperature: 170°C; Value: 3mR; Power Rating: 3W; Tolerance: 1%; Packaging: Cut Tape; Resistor Type: Metal Alloy; Number of Terminations: 2; Termination: Solder; Max Power Dissipation: 3W; Features: Moisture Resistant,Automotive AEC-Q200; Series: CRE2512; Resistance Tolerance: 1%; Technology: METAL STRIP; Length: 0.254inch; Width: 0.132inch; Height: 0.035inch; Depth: 3.35mm; Reach SVHC Compliant: No; RoHS Compliant: No; ComponentLink1URL: https://datasheet.ciiva.com/48532/cre-48532221.pdf?src-supplier=Avnet; ComponentLink1Description: https://datasheet.ciiva.com/48532/cre-48532221.pdf?src-supplier=Avnet; ComponentLink2URL: https://datasheet.ciiva.com/46424/1838634-46424792.pdf?src-supplier=Element14; ComponentLink2Description: https://datasheet.ciiva.com/46424/1838634-46424792.pdf?src-supplier=Element14; ComponentLink3URL: https://datasheet.ciiva.com/46424/1838634-46424793.pdf?src-supplier=Element14; ComponentLink3Description: https://datasheet.ciiva.com/46424/1838634-46424793.pdf?src-supplier=Element14
R2 = CRE2512-FZ-R002E-3: RES 0.002 OHM 1% 3W 2512; Manufacturer: Bourns; Temperature Coefficient: 75ppm/°C; Item Type: Resistor; Supplier: Rs; Supplier Part Number: 2477148; Manufacturer Part Number: CRE2512-FZ-R002E-3; RoHS: No; Category: Chip SMD Resistors; Stock: 7640; Pricing: 10=0.32, 100=0.28, 500=0.23, 1000=0.217, 2000=0.212 (GBP); Mounting Technology: Surface Mount; Case/Package: 2512; Case Code (Metric): 6432; Case Code (Imperial): 2512; Contact Plating: Tin; Min Operating Temperature: -55°C; Max Operating Temperature: 170°C; Value: 2mR; Power Rating: 3W; Tolerance: 1%; Packaging: Cut Tape; Resistor Type: Metal Alloy; Number of Terminations: 2; Termination: Solder; Max Power Dissipation: 3W; Features: Moisture Resistant,Automotive AEC-Q200; Series: CRE2512; Resistance Tolerance: 1%; Technology: METAL STRIP; Length: 0.254inch; Width: 0.132inch; Height: 0.035inch; Depth: 3.35mm; Ratings: AEC-Q200; Reach SVHC Compliant: No; ComponentLink1URL: https://datasheet.ciiva.com/46424/1838634-46424789.pdf?src-supplier=Element14; ComponentLink1Description: https://datasheet.ciiva.com/46424/1838634-46424789.pdf?src-supplier=Element14
R3 = FRP2512F0000TS: 2W Thick Film Resistors ±200ppm/℃ ±1% 0Ω 2512 Chip Resistor - Surface Mount ROHS; Manufacturer: FOJAN; Manufacturer Part Number: FRP2512F0000TS; Package: 2512; LCSC Part Number: C5204052; Item Type: Resistor; ComponentLink1Description: LCSC; ComponentLink1URL: https://www.lcsc.com/product-detail/Chip-Resistor-Surface-Mount_FOJAN-FRP2512F0000TS_C5204052.html
R4 = RC0805JR-075R1L: RES 5.1 OHM 5% 1/8W 0805; Manufacturer: Yageo; Item Type: Resistor; Supplier: Future Electronics; Supplier Part Number: 9870346; Manufacturer Part Number: RC0805JR-075R1L; RoHS: Yes; Category: Chip SMD Resistors; Stock: 15000; Pricing: 5000=0.0054, 20000=0.0051, 75000=0.0048, 200000=0.0046, 500000=0.0043 (USD); ComponentLink1URL: https://datasheet.ciiva.com/2456/pyu-r-int-thick-7-2456339.pdf?src-supplier=Digikey; ComponentLink1Description: https://datasheet.ciiva.com/2456/pyu-r-int-thick-7-2456339.pdf?src-supplier=Digikey; ComponentLink2URL: https://datasheet.ciiva.com/2456/pyu-r-int-thick-7-2456340.pdf?src-supplier=Digikey; ComponentLink2Description: https://datasheet.ciiva.com/2456/pyu-r-int-thick-7-2456340.pdf?src-supplier=Digikey; ComponentLink3URL: https://datasheet.ciiva.com/2456/pyu-r-int-thick-7-2456341.pdf?src-supplier=Digikey; ComponentLink3Description: https://datasheet.ciiva.com/2456/pyu-r-int-thick-7-2456341.pdf?src-supplier=Digikey; ComponentLink4URL: https://datasheet.ciiva.com/17045/rc0805-17045032.pdf?src-supplier=Future+Electronics; ComponentLink4Description: https://datasheet.ciiva.com/17045/rc0805-17045032.pdf?src-supplier=Future+Electronics; ComponentLink5URL: https://datasheet.ciiva.com/5595/rc0805-5595916.pdf?src-supplier=Mouser; ComponentLink5Description: https://datasheet.ciiva.com/5595/rc0805-5595916.pdf?src-supplier=Mouser
R5 R6 R10 R11 R13 R18 = RC0603FR-07100RL: RES SMD 100 OHM 1% 1/10W 0603; Manufacturer: Yageo; Temperature Coefficient: 100ppm/°C; Voltage Rating (DC): 50V; Power Rating: 100mW; Item Type: Resistor; Supplier 1: Arrow Electronics; Manufacturer Part Number: RC0603FR-07100RL; RoHS: Yes; Category: Chip SMD Resistors; Stock 1: 3800000; Pricing 1: 5000=0.00300, 5000=0.00200, 5000=0.00450, 50000=0.00410, 500000=0.00230, 2500000=0.00140 (USD); Case/Package: 0603; Number of Pins: 2; Case Code (Imperial): 0603; Case Code (Metric): 1608; Size Code: 0603; Min Operating Temperature: -55°C; Max Operating Temperature: 155°C; Resistance: 100R; Tolerance: 1%; Resistor Type: Thick Film; Packaging: Tape and Reel; Voltage Rating: 50V; Termination: SMD/SMT; Features: Moisture Resistant; Series: RC; Max Power Dissipation: 100mW; Number of Terminations: 2; Construction: Rectangular; Resistance Tolerance: 1%; Technology: THICK FILM; Length: 1.6mm; Width: 0.8mm; Height: 0.45mm; Depth: 0.8mm; REACH SVHC: Unknown; Lead Free: Lead Free; RoHS Compliant: Yes; Military Standard: Not; Supplier Part Number 1: RC0603FR-07100RL; LCSC Part Number: C105588
R7 R19 R24-R28 = RC0603FR-0710KL: RES SMD 10K Ohm 1% 1/10W 0603; Manufacturer: Yageo; Resistance: 10kR; Temperature Coefficient: 100ppm/°C; Voltage Rating (DC): 50V; Power Rating: 100mW; Voltage Rating: 75V; Item Type: Resistor; Supplier 1: Digi-Key; Manufacturer Part Number: RC0603FR-0710KL; RoHS: Yes; Category: Chip SMD Resistors; Stock 1: 25249139; Pricing 1: 1=0.10000, 10=0.02400, 100=0.00970, 1000=0.00436, 2500=0.00378 (USD); Case/Package: 0603; Number of Pins: 2; Case Code (Imperial): 0603; Case Code (Metric): 1608; Weight: 7.1E-05oz; Size Code: 0603; Min Operating Temperature: -55°C; Max Operating Temperature: 155°C; Tolerance: 1%; Resistor Type: Thick Film; Packaging: Tape and Reel; Termination: SMD/SMT; Features: Moisture Resistant; Series: RC; Max Power Dissipation: 100mW; Number of Terminations: 2; Resistance Tolerance: 1%; Construction: Rectangular; Length: 1.6mm; Width: 0.8mm; Height: 0.45mm; Depth: 0.8mm; Lead Pitch: 0.3mm; REACH SVHC: Unknown; Lead Free: Lead Free; Military Standard: Not; RoHS Compliant: Yes; ComponentLink1URL: https://datasheet.ciiva.com/7660/38590-7660789.pdf?src-supplier=Element14; ComponentLink1Description: https://datasheet.ciiva.com/7660/38590-7660789.pdf?src-supplier=Element14; ComponentLink2URL: https://datasheet.ciiva.com/7983/443971-7983596.pdf?src-supplier=Element14; ComponentLink2Description: https://datasheet.ciiva.com/7983/443971-7983596.pdf?src-supplier=Element14; ComponentLink3URL: https://datasheet.ciiva.com/22747/443971-22747519.pdf?src-supplier=Element14; ComponentLink3Description: https://datasheet.ciiva.com/22747/443971-22747519.pdf?src-supplier=Element14; ComponentLink4URL: https://datasheet.ciiva.com/46440/1868787-46440891.pdf?src-supplier=Element14; ComponentLink4Description: https://datasheet.ciiva.com/46440/1868787-46440891.pdf?src-supplier=Element14; ComponentLink5URL: https://datasheet.ciiva.com/7746/1738695-7746239.pdf?src-supplier=Element14; ComponentLink5Description: https://datasheet.ciiva.com/7746/1738695-7746239.pdf?src-supplier=Element14; ComponentLink6URL: https://datasheet.ciiva.com/15189/getdatasheetpartid-409289-15189591.pdf?src-supplier=Verical; ComponentLink6Description: https://datasheet.ciiva.com/15189/getdatasheetpartid-409289-15189591.pdf?src-supplier=Verical; Supplier Part Number 1: 311-10.0KHRCT-ND; LCSC Part Number: C98220
R8 = AC0603FR-0756KL: RES SMD 56K OHM 1% 1/10W 0603; Manufacturer: Yageo; Item Type: Resistor; Supplier: Future Electronics; Supplier Part Number: 4073924; Manufacturer Part Number: AC0603FR-0756KL; RoHS: Yes; Category: Chip SMD Resistors; Stock: 100000; Pricing: 5000=0.0016, 25000=0.0015, 150000=0.0014, 500000=0.0014, 1500000=0.0013 (USD); ComponentLink1URL: http://www.mouser.com/ds/2/447/yageodocoutput-1111992.pdf?src-supplier=Mouser; ComponentLink1Description: http://www.mouser.com/ds/2/447/yageodocoutput-1111992.pdf?src-supplier=Mouser; ComponentLink2URL: http://www.yageo.com/NewPortal/yageodocoutput?fileName=/pdf/R-Chip/PYu-AC_51_RoHS_L_6.pdf&src-supplier=Digi-Key; ComponentLink2Description: http://www.yageo.com/NewPortal/yageodocoutput?fileName=/pdf/R-Chip/PYu-AC_51_RoHS_L_6.pdf&src-supplier=Digi-Key; ComponentLink3URL: https://datasheet.octopart.com/AC0603FR-0756KL-Yageo-datasheet-151884373.pdf?src-supplier=Future+Electronics; ComponentLink3Description: https://datasheet.octopart.com/AC0603FR-0756KL-Yageo-datasheet-151884373.pdf?src-supplier=Future+Electronics; LCSC Part Number: C144647
R9 R14 = RC0603FR-0710RL: RES SMD 10 OHM 1% 1/10W 0603; Manufacturer: Yageo; Temperature Coefficient: 200ppm/°C; Power Rating: 100mW; Voltage Rating: 50V; Item type: Resistor; Supplier 1: Digi-Key; Manufacturer Part Number: RC0603FR-0710RL; Stock 1: 10836596; Pricing 1: 1=0.1, 10=0.046, 100=0.0187, 1000=0.0084, 2500=0.00729 (USD); Case/Package: 0603; Number of Pins: 2; Case Code (Imperial): 0603; Case Code (Metric): 1608; Contact Plating: Tin,Matte; Min Operating Temperature: -55°C; Max Operating Temperature: 155°C; Resistance: 10R; Tolerance: 1%; Composition: Thick Film; Packaging: Tape and Reel; Voltage Rating (DC): 50V; Termination: SMD/SMT; Military Standard: Not; Length: 1.6mm; Height: 0.45mm; Width: 0.8mm; Depth: 0.8mm; Radiation Hardening: No; Lead Free: Lead Free; REACH SVHC: No SVHC; ComponentLink1URL: http://www.farnell.com/datasheets/1868787.pdf?src-supplier=Element14; ComponentLink1Description: http://www.farnell.com/datasheets/1868787.pdf?src-supplier=Element14; ComponentLink2URL: http://www.yageo.com/documents/recent/PYu-RC0603_51_RoHS_L_4.pdf?src-supplier=Avnet; ComponentLink2Description: http://www.yageo.com/documents/recent/PYu-RC0603_51_RoHS_L_4.pdf?src-supplier=Avnet; ComponentLink3URL: http://documents.rs-components.com/techlib://itc_doclist_GB.htm?stockno=5048984&src-supplier=RSComponents; ComponentLink3Description: http://documents.rs-components.com/techlib://itc_doclist_GB.htm?stockno=5048984&src-supplier=RSComponents; ComponentLink4URL: http://www.yageo.com/documents/recent/PYu-RC0603_51_RoHS_L_4.pdf?src-supplier=Avnet+Europe; ComponentLink4Description: http://www.yageo.com/documents/recent/PYu-RC0603_51_RoHS_L_4.pdf?src-supplier=Avnet+Europe; Supplier Part Number 1: 311-10.0HRDKR-ND; LCSC Part Number: C109318
R12 = RC0603FR-070RL: RES SMD 0R, 1%, 0.1W, 0603; Manufacturer: Yageo; Item Type: Resistor; Manufacturer Part Number: RC0603FR-070RL; Package: 0603; LCSC Part Number: C100044; ComponentLink9Description: LCSC; ComponentLink9URL: https://www.lcsc.com/product-detail/Chip-Resistor-Surface-Mount_YAGEO-RC0603FR-070RL_C100044.html
R15 R16 = CRE2512-FZ-R005E-3: RES 0.005 OHM 1% 3W 2512; Manufacturer: Bourns; Value: 5mR; Temperature Coefficient: 75ppm/°C; Item Type: Resistor; Supplier: Digikey; Supplier Part Number: CRE2512-FZ-R005E-3CT-ND; Manufacturer Part Number: CRE2512-FZ-R005E-3; RoHS: No; Category: Chip SMD Resistors; Stock: 75916; Pricing: 1=0.73, 10=0.509, 25=0.4356, 50=0.3788, 100=0.2967, 250=0.27144, 500=0.22094, 1000=0.17524 (USD); Mounting Technology: Surface Mount; Case/Package: 2512; Case Code (Metric): 6432; Case Code (Imperial): 2512; Contact Plating: Tin; Min Operating Temperature: -55°C; Max Operating Temperature: 170°C; Power Rating: 3W; Tolerance: 1%; Packaging: Cut Tape; Resistor Type: Metal Alloy; Number of Terminations: 2; Termination: Solder; Max Power Dissipation: 3W; Features: Moisture Resistant,Automotive AEC-Q200; Series: CRE2512; Resistance Tolerance: 1%; Technology: METAL STRIP; Length: 0.254inch; Width: 0.132inch; Height: 0.035inch; Depth: 3.35mm; Reach SVHC Compliant: No; ComponentLink1URL: https://datasheet.ciiva.com/48532/cre-48532215.pdf?src-supplier=Avnet; ComponentLink1Description: https://datasheet.ciiva.com/48532/cre-48532215.pdf?src-supplier=Avnet
R17 = RC0603FR-07113KL: RES 113K OHM 1% 1/10W 0603; Manufacturer: Yageo; Value: 113kR; Temperature Coefficient: 100ppm/°C; Power Rating: 100mW; Voltage Rating: 50V; Supplier: Digikey; Supplier Part Number: 311-113KHRCT-ND; Manufacturer Part Number: RC0603FR-07113KL; RoHS: Yes; Category: Chip SMD Resistors; Stock: 1058641; Pricing: 1=0.1, 10=0.019, 50=0.0112, 100=0.0093, 500=0.00622, 1000=0.00532 (USD); Case/Package: 0603; Contact Plating: Tin,Lead; Case Code (Imperial): 0603; Case Code (Metric): 1608; Min Operating Temperature: -55°C; Max Operating Temperature: 155°C; Tolerance: 1%; Packaging: Tape and Reel; Termination: SMD/SMT; Voltage Rating (DC): 50V; Features: Moisture Resistant; Series: RC; Max Power Dissipation: 100mW; Number of Terminations: 2; Length: 1.6mm; Width: 0.8mm; Height: 0.45mm; Lead Free: Lead Free; RoHS Compliant: Resistor; ComponentLink1URL: http://www.mouser.com/catalog/specsheets/RC0603.pdf?src-supplier=Mouser; ComponentLink1Description: http://www.mouser.com/catalog/specsheets/RC0603.pdf?src-supplier=Mouser; ComponentLink2URL: http://www.yageo.com/pdf/PYu-RC0603_51_RoHS_L_4.pdf?src-supplier=Avnet; ComponentLink2Description: http://www.yageo.com/pdf/PYu-RC0603_51_RoHS_L_4.pdf?src-supplier=Avnet; ComponentLink3URL: http://www.yageo.com/documents/recent/PYu-RC_Group_51_RoHS_L_9.pdf?src-supplier=Digikey; ComponentLink3Description: http://www.yageo.com/documents/recent/PYu-RC_Group_51_RoHS_L_9.pdf?src-supplier=Digikey; ComponentLink4URL: http://www.yageo.com/documents/recent/PYu-RC_Group_51_RoHS_L_10.pdf?src-supplier=Digikey; ComponentLink4Description: http://www.yageo.com/documents/recent/PYu-RC_Group_51_RoHS_L_10.pdf?src-supplier=Digikey; ComponentLink5URL: https://datasheet.octopart.com/RC0603FR-07113KL-Yageo-datasheet-118562.pdf?src-supplier=Digikey; ComponentLink5Description: https://datasheet.octopart.com/RC0603FR-07113KL-Yageo-datasheet-118562.pdf?src-supplier=Digikey; ComponentLink6URL: http://www.yageo.com/documents/recent/PYu-RC0603_51_RoHS_L_7.pdf?src-supplier=Future+Electronics; ComponentLink6Description: http://www.yageo.com/documents/recent/PYu-RC0603_51_RoHS_L_7.pdf?src-supplier=Future+Electronics; ComponentLink7URL: https://datasheet.octopart.com/RC0603FR-07113KL-Yageo-datasheet-164759695.pdf?src-supplier=Future+Electronics; ComponentLink7Description: https://datasheet.octopart.com/RC0603FR-07113KL-Yageo-datasheet-164759695.pdf?src-supplier=Future+Electronics
R20 = RC0603FR-0718KL: RES 18K OHM 1% 1/10W 0603; Manufacturer: Yageo; Power Rating: 100mW; Voltage Rating: 75V; Voltage Rating (DC): 50V; Temperature Coefficient: 100ppm/°C; Resistance: 18kR; Supplier 1: Digi-Key; Supplier Part Number 1: 311-18.0KHRCT-ND; Manufacturer Part Number: RC0603FR-0718KL; RoHS: Yes; Category: Chip SMD Resistors; Stock 1: 1173301; Pricing 1: 1=0.10000, 10=0.02300, 100=0.00930, 1000=0.00417, 2500=0.00362 (USD); Case/Package: 0603; Number of Pins: 2; Case Code (Imperial): 0603; Case Code (Metric): 1608; Weight: 7.1E-05oz; Size Code: 0603; Min Operating Temperature: -55°C; Max Operating Temperature: 155°C; Resistor Type: Thick Film; Tolerance: 1%; Packaging: Tape and Reel; Termination: SMD/SMT; Features: Moisture Resistant; Series: RC; Max Power Dissipation: 100mW; Number of Terminations: 2; Resistance Tolerance: 1%; Technology: THICK FILM; Construction: Rectangular; Length: 1.6mm; Width: 0.8mm; Height: 0.45mm; Depth: 0.8mm; RoHS Compliant: Yes; REACH SVHC: Unknown; Military Standard: Not; Lead Free: Lead Free; ComponentLink1URL: https://datasheet.ciiva.com/11819/0900766b80f96399-11819270.pdf?src-supplier=RSComponents; ComponentLink1Description: https://datasheet.ciiva.com/11819/0900766b80f96399-11819270.pdf?src-supplier=RSComponents; ComponentLink2URL: https://datasheet.ciiva.com/7746/443971-7746268.pdf?src-supplier=Element14; ComponentLink2Description: https://datasheet.ciiva.com/7746/443971-7746268.pdf?src-supplier=Element14; ComponentLink3URL: https://datasheet.ciiva.com/7746/443971-7746269.pdf?src-supplier=Element14; ComponentLink3Description: https://datasheet.ciiva.com/7746/443971-7746269.pdf?src-supplier=Element14; ComponentLink4URL: https://datasheet.ciiva.com/15189/getdatasheetpartid-325162-15189626.pdf?src-supplier=Verical; ComponentLink4Description: https://datasheet.ciiva.com/15189/getdatasheetpartid-325162-15189626.pdf?src-supplier=Verical; Supplier 2: Digi-Key; Stock 2: 1087850; Pricing 2: 1=0.10000, 10=0.02300, 100=0.00930, 1000=0.00417, 2500=0.00362 (USD); Package Quantity: 5000; ComponentLink5URL: https://datasheet.ciiva.com/46395/443971-46395003.pdf?src-supplier=Element14; ComponentLink5Description: https://datasheet.ciiva.com/46395/443971-46395003.pdf?src-supplier=Element14; ComponentLink6URL: https://datasheet.ciiva.com/12558/rc0603-272842-12558744.pdf?src-supplier=Mouser; ComponentLink6Description: https://datasheet.ciiva.com/12558/rc0603-272842-12558744.pdf?src-supplier=Mouser; Supplier Part Number 2: 311-30.0KHRCT-ND; LCSC Part Number: C114610
R21 = RC0603FR-078K06L: RES 8.06K OHM 1% 1/10W 0603; Manufacturer: Yageo; Value: 8.06kR; Temperature Coefficient: 100ppm/°C; Power Rating: 100mW; Voltage Rating: 75V; Voltage Rating (DC): 50V; Item Type: Resistor; Supplier: Digikey; Supplier Part Number: 311-8.06KHRCT-ND; Manufacturer Part Number: RC0603FR-078K06L; RoHS: Yes; Category: Chip SMD Resistors; Stock: 341075; Pricing: 1=0.1, 10=0.019, 50=0.0112, 100=0.0093, 500=0.00622, 1000=0.00532 (USD); Case/Package: 0603; Contact Plating: Tin,Lead; Case Code (Metric): 1608; Case Code (Imperial): 0603; Weight: 7.1E-05oz; Min Operating Temperature: -55°C; Max Operating Temperature: 155°C; Tolerance: 1%; Packaging: Tape and Reel; Number of Terminations: 2; Termination: SMD/SMT; Max Power Dissipation: 100mW; Features: Moisture Resistant; Series: RC; Construction: Rectangular; Length: 1.6mm; Width: 0.8mm; Height: 0.45mm; Depth: 0.8mm; Military Standard: Not; Lead Free: Lead Free; RoHS Compliant: Yes; ComponentLink1URL: https://datasheet.ciiva.com/2454/pyu-r-int-thick-7-2454021.pdf?src-supplier=Digikey; ComponentLink1Description: https://datasheet.ciiva.com/2454/pyu-r-int-thick-7-2454021.pdf?src-supplier=Digikey; ComponentLink2URL: https://datasheet.ciiva.com/2454/pyu-r-int-thick-7-2454022.pdf?src-supplier=Digikey; ComponentLink2Description: https://datasheet.ciiva.com/2454/pyu-r-int-thick-7-2454022.pdf?src-supplier=Digikey; ComponentLink3URL: https://datasheet.ciiva.com/2454/pyu-r-int-thick-7-2454023.pdf?src-supplier=Digikey; ComponentLink3Description: https://datasheet.ciiva.com/2454/pyu-r-int-thick-7-2454023.pdf?src-supplier=Digikey
R22 = RC0603FR-0741K2L: RES SMD 41.2K Ohm 1% 1/10W 0603; Manufacturer: Yageo; Resistance: 41.2kR; Power Rating: 100mW; Voltage Rating: 50V; Temperature Coefficient: 100ppm/°C; Supplier 1: Digi-Key; Manufacturer Part Number: RC0603FR-0741K2L; RoHS: Yes; Category: Chip SMD Resistors; Stock 1: 224401; Pricing 1: 1=0.10000, 10=0.02400, 100=0.00970, 1000=0.00436, 2500=0.00378 (USD); Case/Package: 0603; Case Code (Metric): 1608; Case Code (Imperial): 0603; Size Code: 0603; Min Operating Temperature: -55°C; Max Operating Temperature: 155°C; Tolerance: 1%; Package Quantity: 1; Packaging: Tape and Reel; Resistor Type: Thick Film; Number of Terminations: 2; Termination: SMD/SMT; Max Power Dissipation: 100mW; Voltage Rating (DC): 50V; Features: Moisture Resistant; Series: RC; Length: 0.063inch; Width: 0.031inch; Height: 0.022inch; RoHS Compliant: Yes; Lead Free: Lead Free; ComponentLink1URL: https://datasheet.ciiva.com/2454/pyu-r-int-thick-7-2454603.pdf?src-supplier=Digi-Key; ComponentLink1Description: https://datasheet.ciiva.com/2454/pyu-r-int-thick-7-2454603.pdf?src-supplier=Digi-Key; ComponentLink2URL: https://datasheet.ciiva.com/2454/pyu-r-int-thick-7-2454605.pdf?src-supplier=Digi-Key; ComponentLink2Description: https://datasheet.ciiva.com/2454/pyu-r-int-thick-7-2454605.pdf?src-supplier=Digi-Key; ComponentLink3URL: https://datasheet.ciiva.com/2454/pyu-r-int-thick-7-2454604.pdf?src-supplier=Digi-Key; ComponentLink3Description: https://datasheet.ciiva.com/2454/pyu-r-int-thick-7-2454604.pdf?src-supplier=Digi-Key; ComponentLink4URL: https://datasheet.ciiva.com/12558/rc0603-272842-12558556.pdf?src-supplier=Mouser; ComponentLink4Description: https://datasheet.ciiva.com/12558/rc0603-272842-12558556.pdf?src-supplier=Mouser; Supplier Part Number 1: 311-41.2KHRCT-ND; LCSC Part Number: C185330